# Altium schematic sheet 03_KOM_ACB23_4009_Remarks.SchDoc: Remarks
size A4; DocumentNumber: 2023-03-28; Revision: v0.11; SheetNumber: 3; SheetTotal: 9
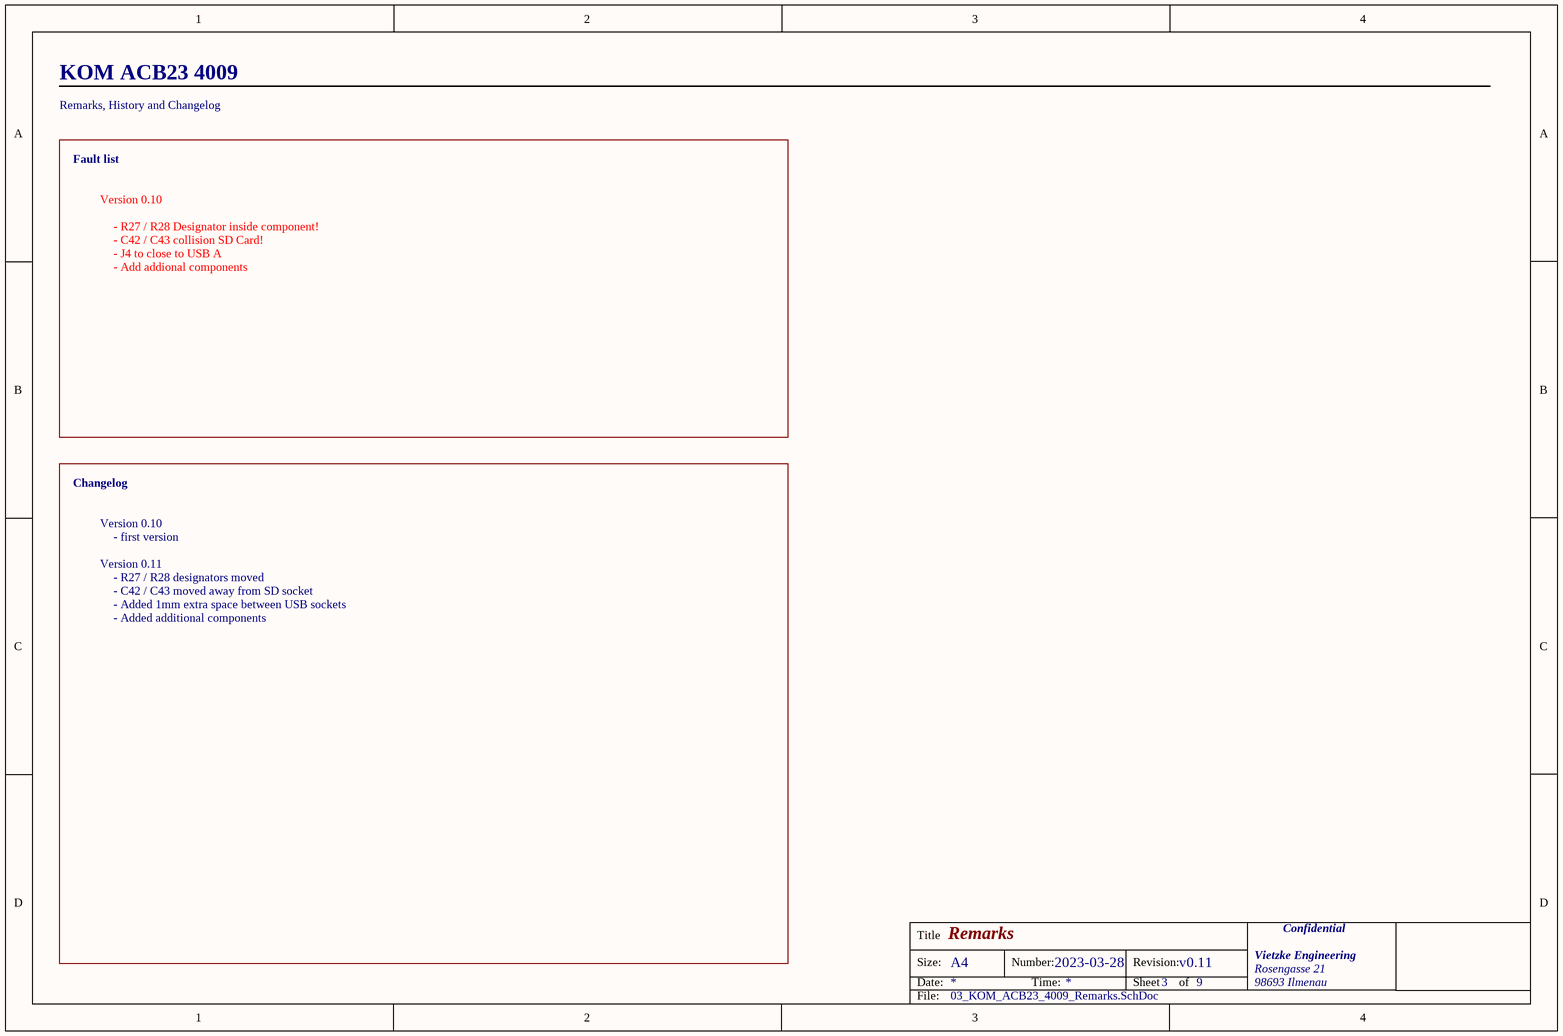
[diagram p0: 03_KOM_ACB23_4009_Remarks.SchDoc]

## Notes on the sheet
- KOM ACB23 4009
- Remarks, History and Changelog
- Fault list
- Version 0.10
- - R27 / R28 Designator inside component!
- - C42 / C43 collision SD Card!
- - J4 to close to USB A
- - Add addional components
- Changelog
- Version 0.11
- - first version
- - R27 / R28 designators moved
- - C42 / C43 moved away from SD socket
- - Added 1mm extra space between USB sockets
- - Added additional components
- Title
- Size:
- Date:
- A4
- Number:
- Time:
- Revision:
- Sheet
- of
- Vietzke Engineering
- Rosengasse 21
- 98693 Ilmenau
- Confidential
- File: